# EAGLE design rotor_khamex_3.1 (EAGLE 7.6.0)

## Sheet 1 of 2
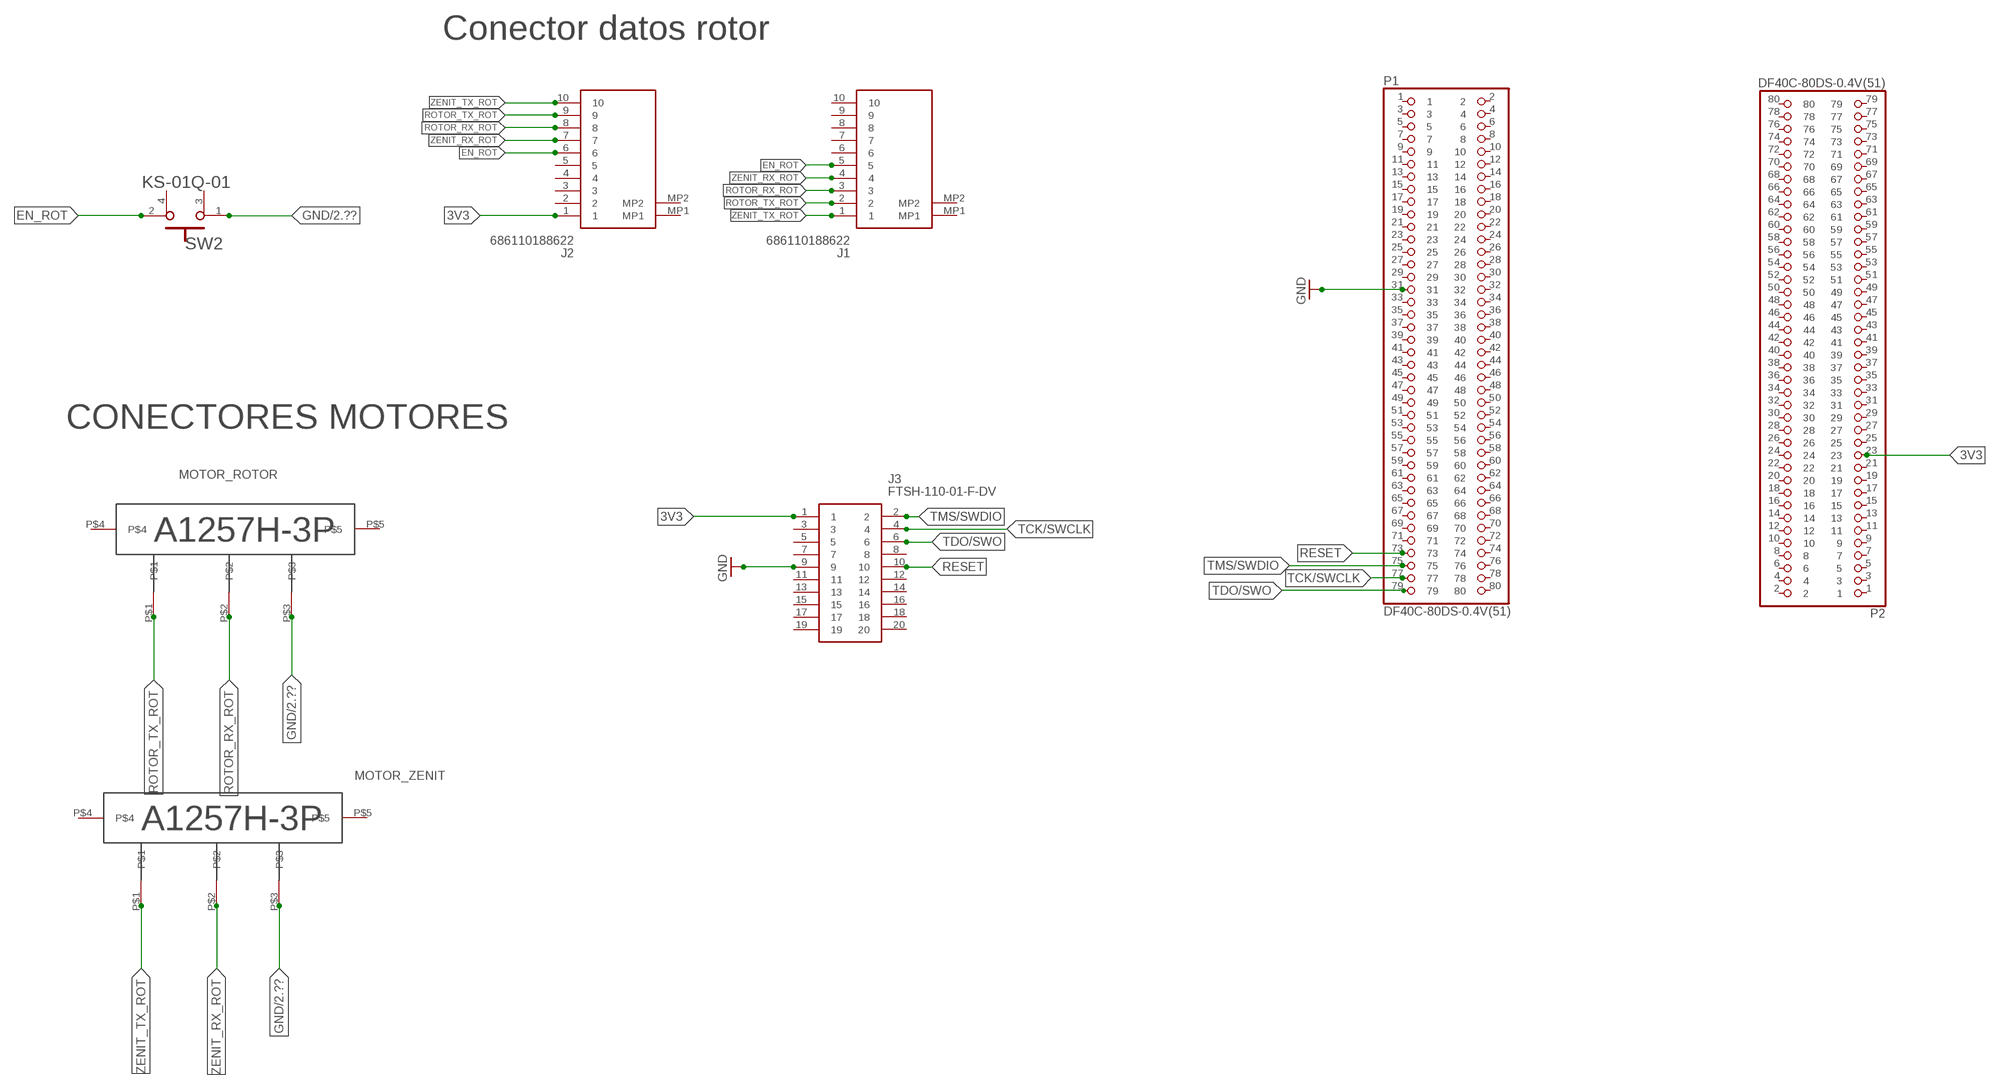
[diagram p0: schematic, sheet 1]

### Parts
J1  686110188622  [686110188622]
J2  686110188622  [686110188622]
J3  FTSH-110-01-F-DV  [FTSH-110-XX-YYY-DV]
MOTOR_ROTOR  A1257H-3P_DEVICE  [A1257H-3P_PACK]
MOTOR_ZENIT  A1257H-3P_DEVICE  [A1257H-3P_PACK]
P1  DF40C-80DS-0.4V(51)  [HRS_DF40C-80DS-0.4V(51)]
P2  DF40C-80DS-0.4V(51)  [HRS_DF40C-80DS-0.4V(51)]
SW2  E-SWITCH_KS-01Q-01E-SWITCH_KS-01Q-01_0_0  [E-SWITCH_KS-01Q-01_0]

### Nets
3V3: J2.1 J3.1 P2.23
EN_ROT: J1.5 J2.6 SW2.2
GND: J3.9 MOTOR_ROTOR.P$3 MOTOR_ZENIT.P$3 P1.31 SW2.1 ; also sheet 2
RESET: J3.10 P1.73
ROTOR_RX_ROT: J1.3 J2.8 MOTOR_ROTOR.P$2
ROTOR_TX_ROT: J1.2 J2.9 MOTOR_ROTOR.P$1
TCK/SWCLK: J3.4 P1.77
TDO/SWO: J3.6
TMS/SWDIO: J3.2 P1.75
ZENIT_RX_ROT: J1.4 J2.7 MOTOR_ZENIT.P$2
ZENIT_TX_ROT: J1.1 J2.10 MOTOR_ZENIT.P$1
Unconnected: J1.6 J1.7 J1.8 J1.9 J1.10 J1.MP1 J1.MP2 J2.2 J2.3 J2.4 J2.5 J2.MP1 J2.MP2 J3.3 J3.5 J3.7 J3.8 J3.11 J3.12 J3.13 J3.14 J3.15 J3.16 J3.17 J3.18 J3.19 J3.20 MOTOR_ROTOR.P$4 MOTOR_ROTOR.P$5 MOTOR_ZENIT.P$4 MOTOR_ZENIT.P$5 P1.1 P1.2 P1.3 P1.4 P1.5 P1.6 P1.7 P1.8 P1.9 P1.10 P1.11 P1.12 P1.13 P1.14 P1.15 P1.16 P1.17 P1.18 P1.19 P1.20 P1.21 P1.22 P1.23 P1.24 P1.25 P1.26 P1.27 P1.28 P1.29 P1.30 P1.32 P1.33 P1.34 P1.35 P1.36 P1.37 P1.38 P1.39 P1.40 P1.41 P1.42 P1.43 P1.44 P1.45 P1.46 P1.47 P1.48 P1.49 P1.50 P1.51 P1.52 P1.53 P1.54 P1.55 P1.56 P1.57 P1.58 P1.59 P1.60 P1.61 P1.62 P1.63 P1.64 P1.65 P1.66 P1.67 P1.68 P1.69 P1.70 P1.71 P1.72 P1.74 P1.76 P1.78 P1.79 P1.80 P2.1 P2.2 P2.3 P2.4 P2.5 P2.6 P2.7 P2.8 P2.9 P2.10 P2.11 P2.12 P2.13 P2.14 P2.15 P2.16 P2.17 P2.18 P2.19 P2.20 P2.21 P2.22 P2.24 P2.25 P2.26 P2.27 P2.28 P2.29 P2.30 P2.31 P2.32 P2.33 P2.34 P2.35 P2.36 P2.37 P2.38 P2.39 P2.40 P2.41 P2.42 P2.43 P2.44 P2.45 P2.46 P2.47 P2.48 P2.49 P2.50 P2.51 P2.52 P2.53 P2.54 P2.55 P2.56 P2.57 P2.58 P2.59 P2.60 P2.61 P2.62 P2.63 P2.64 P2.65 P2.66 P2.67 P2.68 P2.69 P2.70 P2.71 P2.72 P2.73 P2.74 P2.75 P2.76 P2.77 P2.78 P2.79 P2.80 SW2.3 SW2.4

### Notes on the sheet
- Conector datos rotor
- CONECTORES MOTORES
- MOTOR_ROTOR
- MOTOR_ZENIT

## Sheet 2 of 2
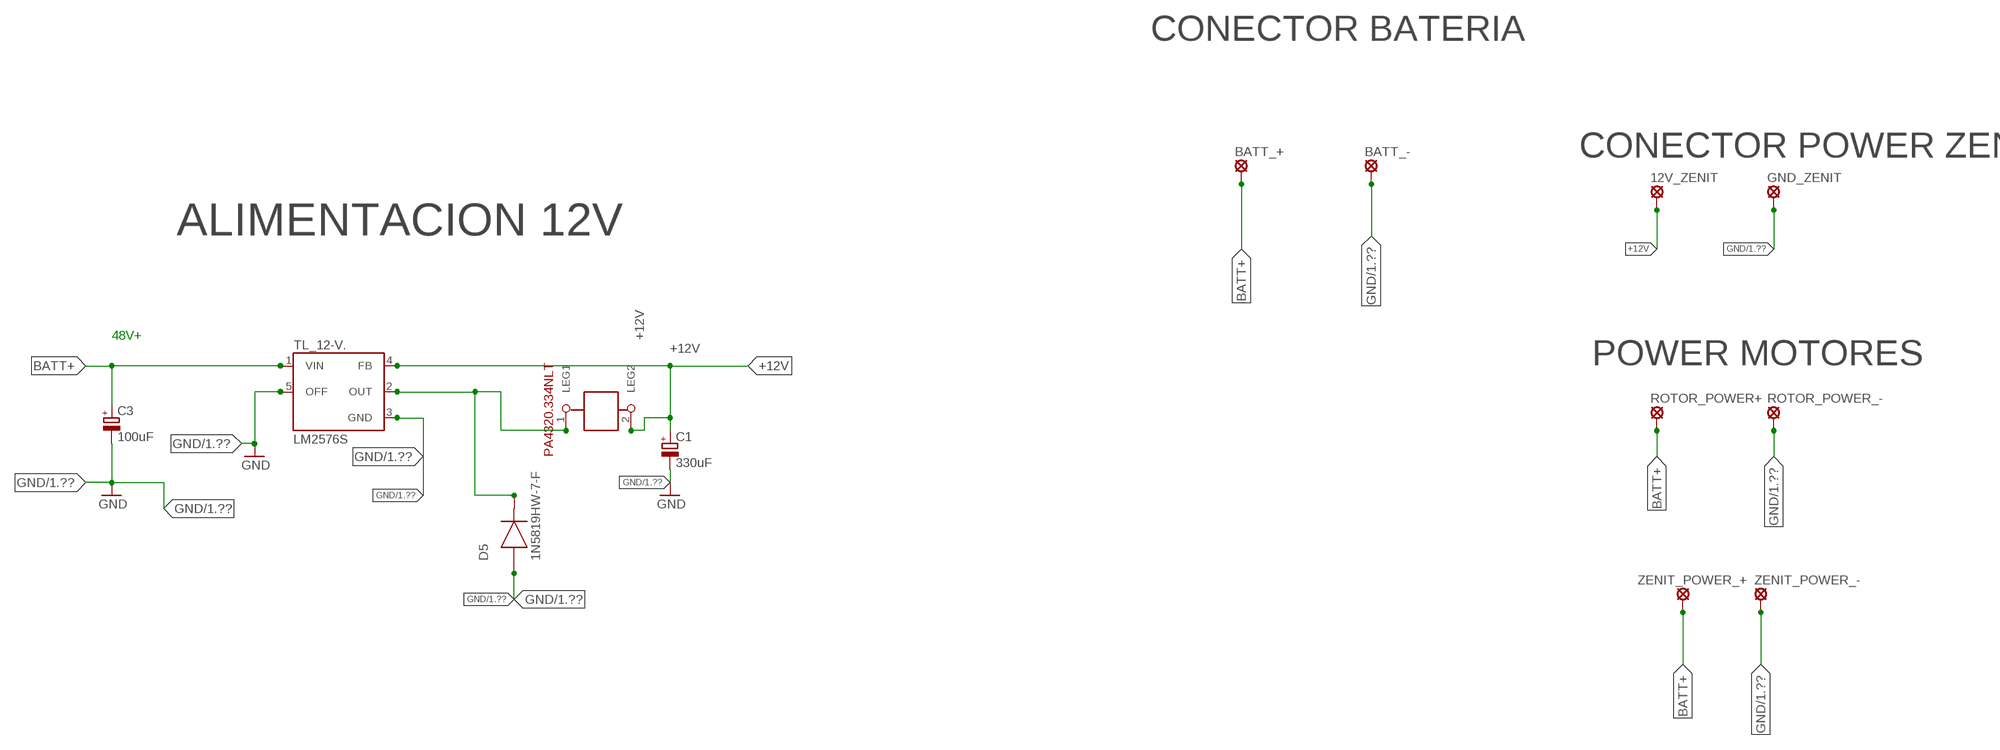
[diagram p1: schematic, sheet 2]

### Parts
12V_ZENIT  SE14  [SE14]
BATT_+  SE14  [SE14]
BATT_-  SE14  [SE14]
C1  330uF  CPOL-EUE5-10.5  [E5-10,5]
C3  100uF  CPOL-EUE5-10.5  [E5-10,5]
D5  1N5819HW-7-F  [SOD370155X135]
GND_ZENIT  SE14  [SE14]
L  1212  [1212SMDINDUCTORPACK]
ROTOR_POWER+  SE14  [SE14]
ROTOR_POWER_-  SE14  [SE14]
TL_12-V.  LM2576S  [TO263-5]
ZENIT_POWER_+  SE14  [SE14]
ZENIT_POWER_-  SE14  [SE14]

### Nets
+12V [power]: 12V_ZENIT.MP C1.+ L.2(LEG2) TL_12-V..4(FB)
BATT+: BATT_+.MP C3.+ ROTOR_POWER+.MP TL_12-V..1(VIN) ZENIT_POWER_+.MP
GND: BATT_-.MP C1.- C3.- D5.2(A) GND_ZENIT.MP ROTOR_POWER_-.MP TL_12-V..3(GND) TL_12-V..5(OFF) ZENIT_POWER_-.MP ; also sheet 1
N$2 [power]: D5.1(C) L.1(LEG1) TL_12-V..2(OUT)

### Notes on the sheet
- CONECTOR BATERIA
- CONECTOR POWER ZENIT
- ALIMENTACION 12V
- 48V+
- POWER MOTORES

## Library data of the parts
12V_ZENIT BATT_+ BATT_- GND_ZENIT ROTOR_POWER+ ROTOR_POWER_- ZENIT_POWER_+ ZENIT_POWER_- = solpad:SE14: SOLDER PAD E1553, drill 1,4mm, distributor Buerklin, 07F820
C1 C3 = rcl:CPOL-EU: POLARIZED CAPACITOR, European symbol
D5 = 1N5819HW-7-F:1N5819HW-7-F: 1N5819HW Series 40 V 1 A Surface Mount Schottky Barrier Rectifier - SOD-123; DESCRIPTION: 1N5819HW Series 40 V 1 A Surface Mount Schottky Barrier Rectifier - SOD-123; DIGI-KEY_PART_NUMBER: 1N5819HW-FDICT-ND; DIGI-KEY_PURCHASE_URL: https://www.digikey.es/product-detail/en/diodes-incorporated/1N5819HW-7-F/1N5819HW-FDICT-ND/815283?utm_source=snapeda&utm_medium=aggregator&utm_campaign=symbol; MF: Diodes Inc.; MP: 1N5819HW-7-F; PACKAGE: SOD-123 Diodes Inc.
J1 J2 = 686110188622:686110188622: FFC & FPC Connectors WR-FPC 1,0mm SMT Horiz. Top Contact Tin Plating{0000} Source: Datasheet <https://www.mouser.ch/datasheet/2/445/686110188622-1843591.pdf>; DESCRIPTION: FFC & FPC Connectors WR-FPC 1,0mm SMT Horiz. Top Contact Tin Plating{0000}; HEIGHT: 3.3mm; MANUFACTURER_NAME: Wurth Elektronik; MANUFACTURER_PART_NUMBER: 686110188622; MOUSER_PART_NUMBER: 710-686110188622; MOUSER_PRICE-STOCK: https://www.mouser.co.uk/ProductDetail/Wurth-Elektronik/686110188622?qs=OlC7AqGiEDnHUpT6yh27Lg%3D%3D
J3 = FTSH-110-01-F-DV:FTSH-110-01-F-DV: 20 Position, High Reliability Header Strips, 0.050" pitch Source: Datasheet <http://suddendocs.samtec.com/prints/ftsh-1xx-xx-xxx-dv-xxx-xxx-mkt.pdf>; DESCRIPTION: 20 Position, High Reliability Header Strips, 0.050&quot; pitch; HEIGHT: mm; MANUFACTURER_NAME: SAMTEC; MANUFACTURER_PART_NUMBER: FTSH-110-01-F-DV; MOUSER_PART_NUMBER: 200-FTSH11001FDV; MOUSER_PRICE-STOCK: https://www.mouser.co.uk/ProductDetail/Samtec/FTSH-110-01-F-DV?qs=92ilVni64gw1JaTDl9rCLg%3D%3D
L = smd 1212 inductor:1212
MOTOR_ROTOR MOTOR_ZENIT = A1257H-3P:A1257H-3P_DEVICE
P1 P2 = DF40C-80DS-0.4V_51_(1):DF40C-80DS-0.4V(51); CHECK_PRICES: https://www.snapeda.com/parts/DF40C-80DS-0.4V(51)/Hirose/view-part/?ref=eda; DESCRIPTION: Receptáculo del conector de la posición 80, contactos de la tira central Montaje en superficie Oro; DIGIKEY_PART_NUMBER: H11633CT-ND; MF: Hirose; MP: DF40C-80DS-0.4V(51); PACKAGE: None; SNAPEDA_LINK: https://www.snapeda.com/parts/DF40C-80DS-0.4V(51)/Hirose/view-part/?ref=snap
SW2 = E-Switch - KS-01Q-01:E-SWITCH_KS-01Q-01: Pushbutton Switch SPST-NO Standard Through Hole; ACTUATOR_TYPE: Round, Button; CAPACITANCE: 1.0pF; CURRENT_RATING: 10mA (DC); DATASHEET: https://upverter.com/datasheet/3b708556f29b55c7f5db677c77a74973be95ebea.pdf; DIGIKEY_DESCRIPTION: SWITCH Pushbutton Switch SPST-NO Standard Through Hole; DIGIKEY_PART_NUMBER: EG4791-ND; ELECTRICAL_LIFE: 250,000 Cycles; IMPORTED_FROM: octopart; LEAD_FREE: yes; MECHANICAL_LIFE: 500,000 Cycles; MF: E-Switch; MFG_PACKAGE_IDENT: 29-KS01Q01; MOUSER_PART_NUMBER: 612-KS-01Q-01; MPN: KS-01Q-01; NUM_PINS: 4; OCTOPART_PART_NUMBER: 72a6bab923faad61; PACKAGE: SW_PTH_12MM; PREFIX: SW; ROHS: yes; TEMPERATURE_RANGE_HIGH: +85°C; TEMPERATURE_RANGE_LOW: -20°C; VOLTAGE_RATING_-_DC: 35V; VOLTAGE_RATING_AC: 35 V
TL_12-V. = v-reg-3:LM2576: National Semiconductor <http://www.national.com> 3.0A "Simple Switcher"(c) 52kHz, Vout 1.23-37V (HV: 57V), Vin 40V (HV: 60V), 50µA standby current

## Net classes
0 default: width 0.381 mm, drill 0.01 mm, clearance 0.254 mm
1 power: width 1.27 mm, drill 0.762 mm, clearance 0.254 mm
2 thin: width 0.254 mm, drill 0.254 mm, clearance 0.254 mm

## Board
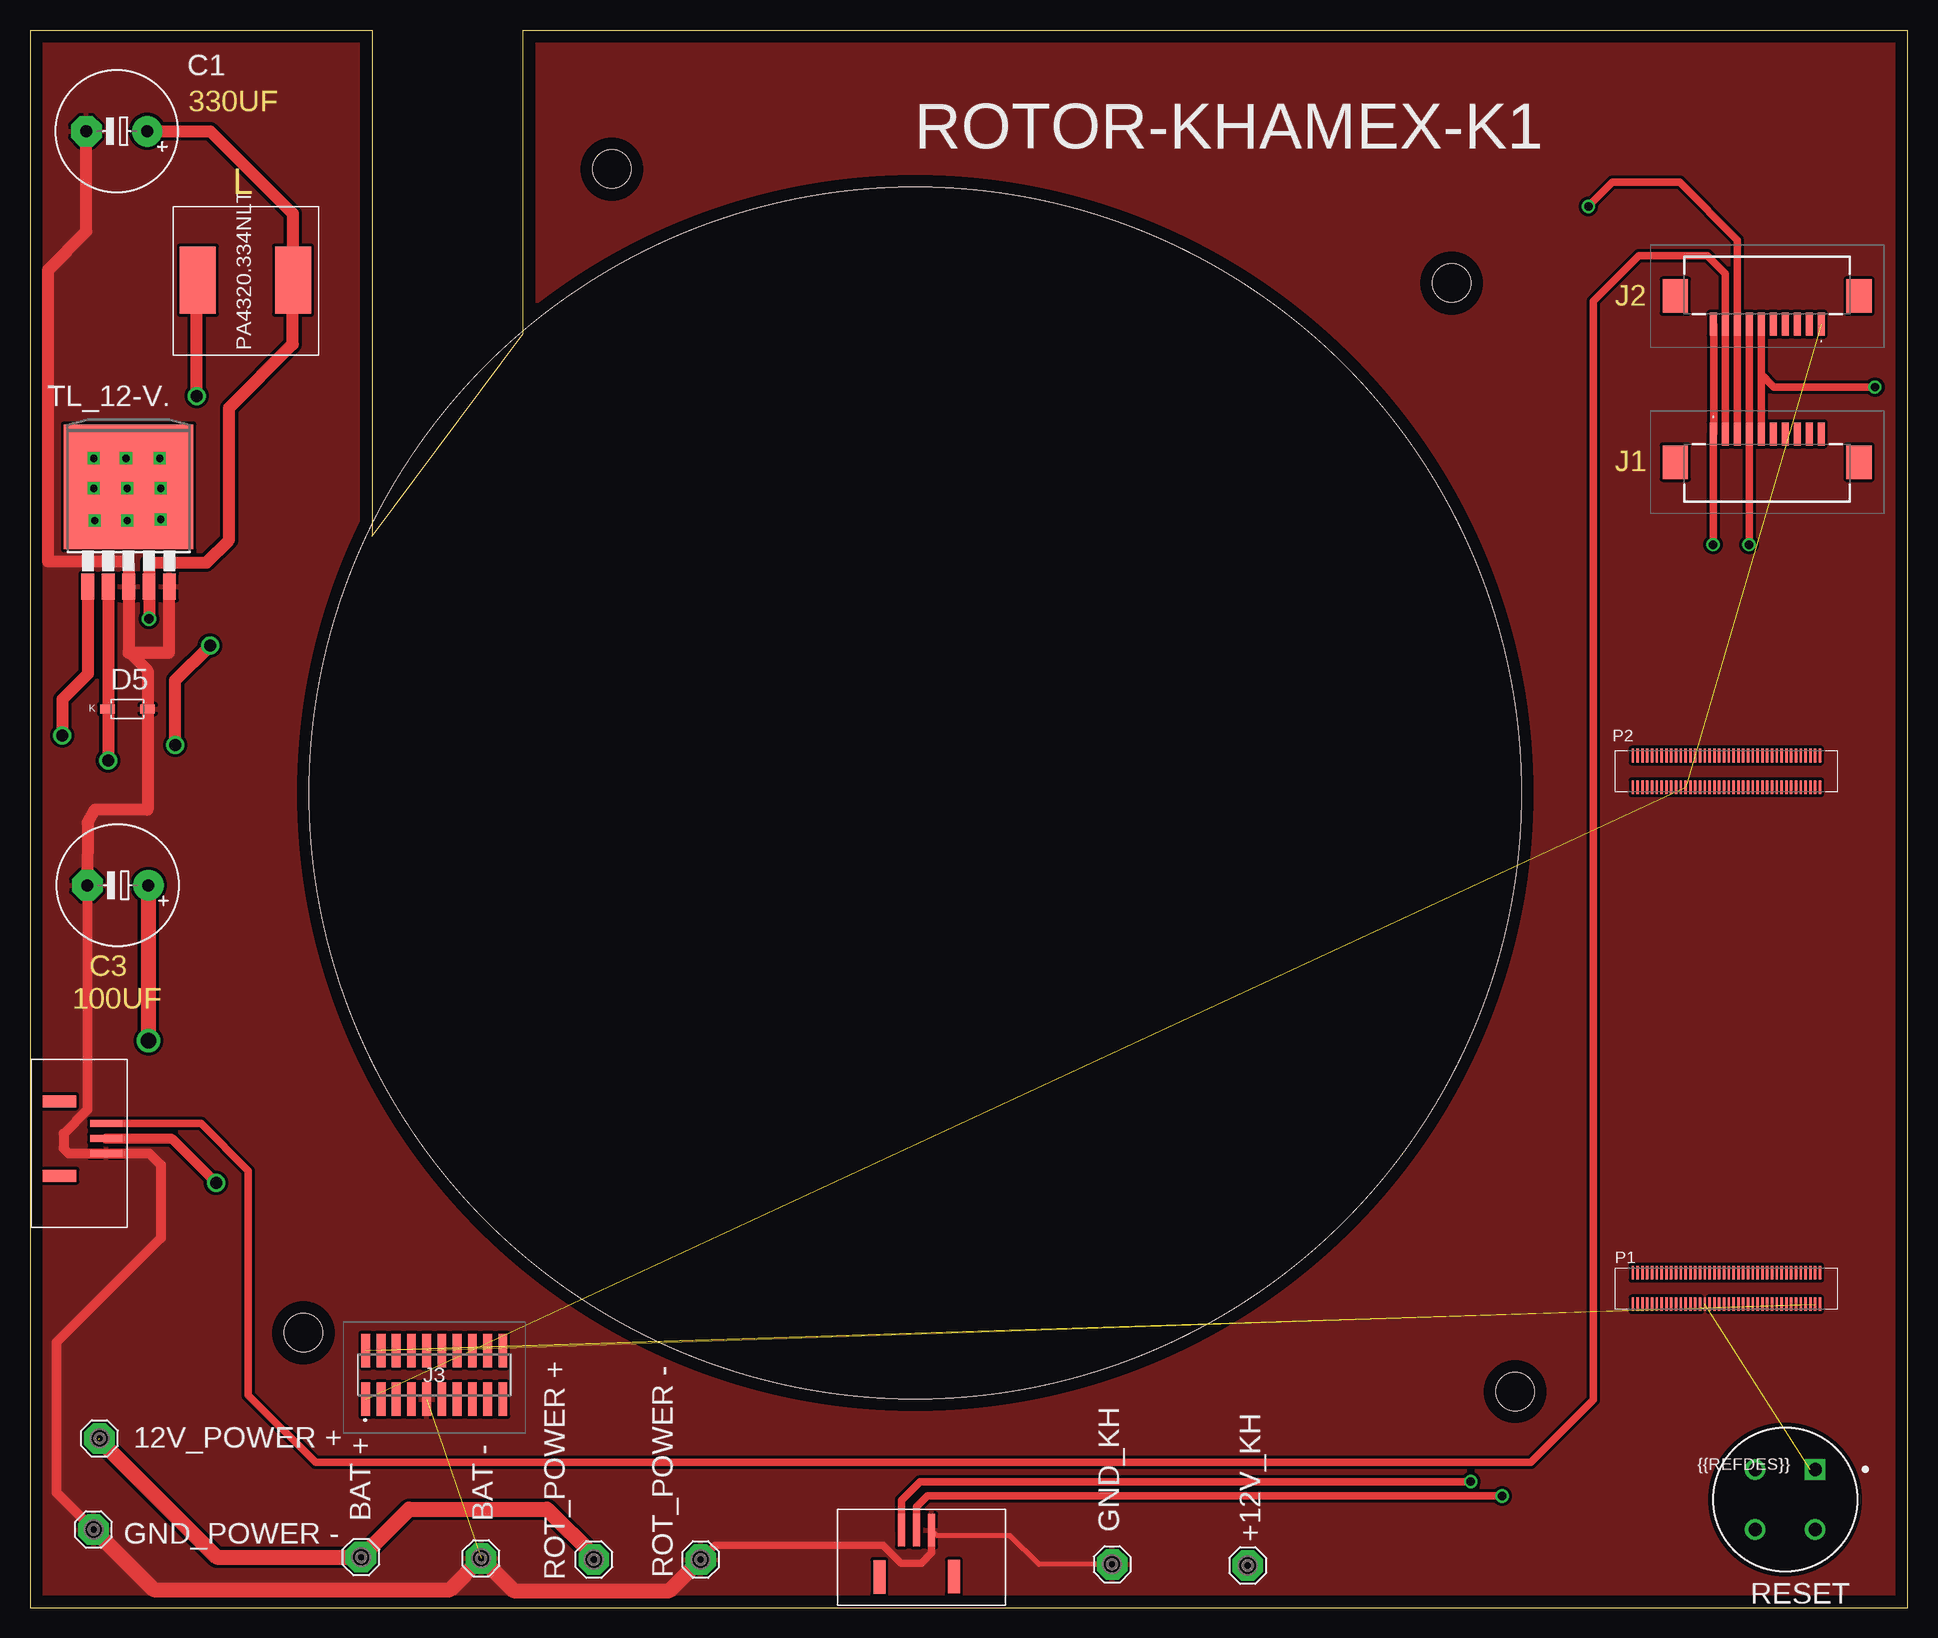
[diagram p2: board, top side]
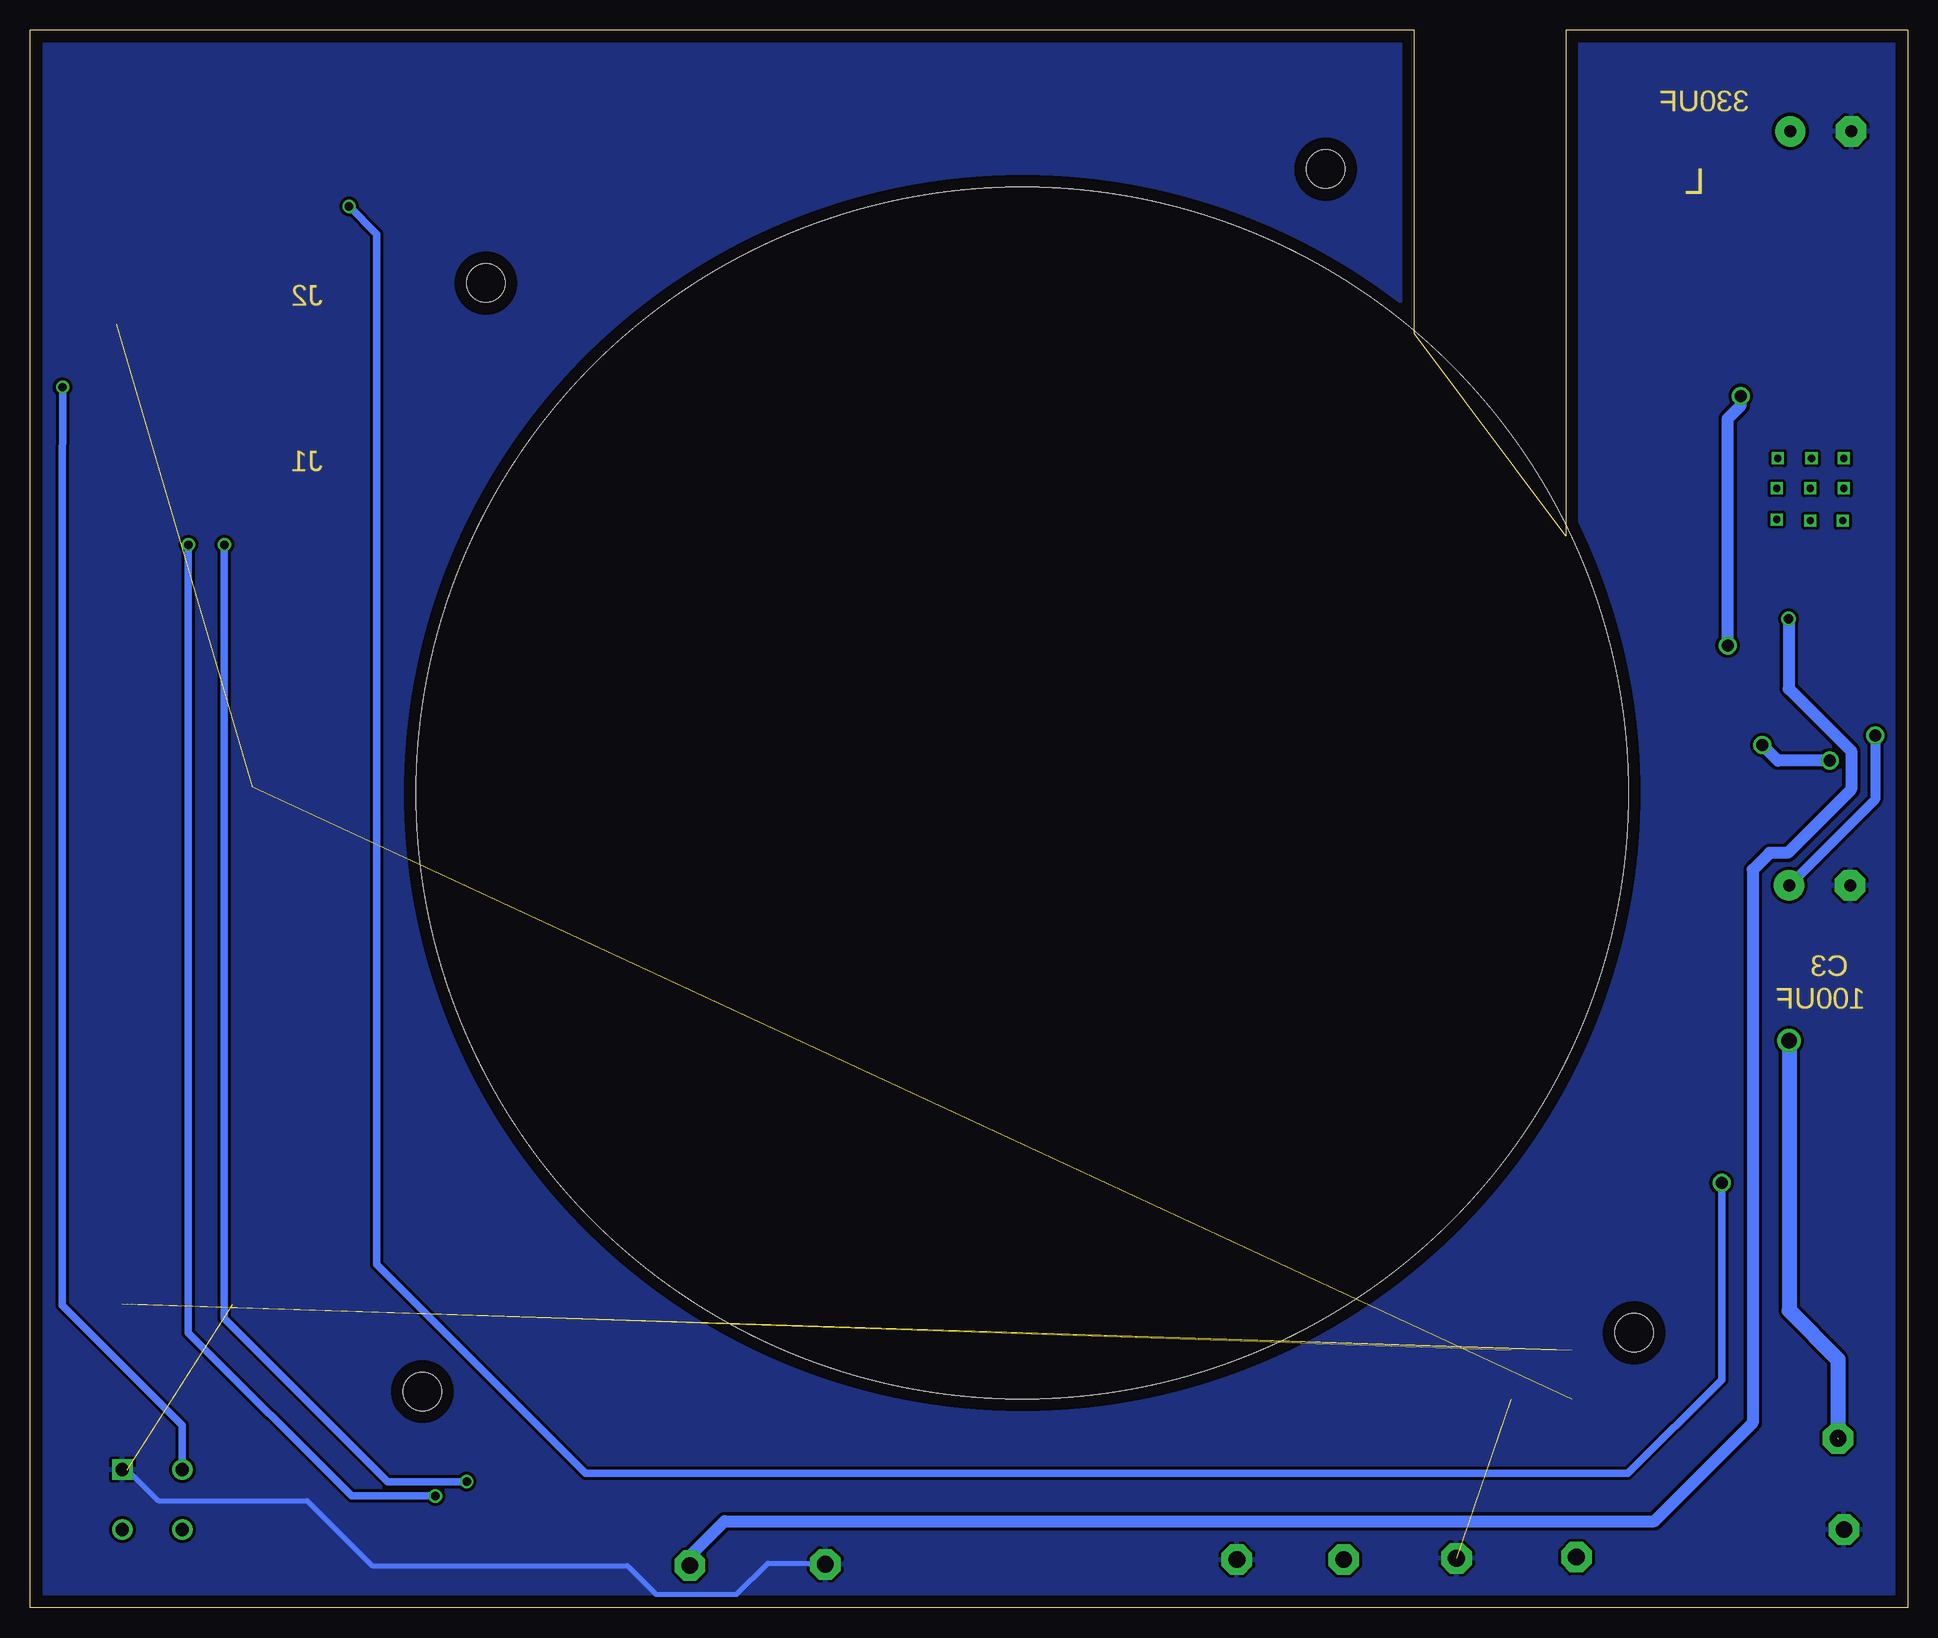
[diagram p3: board, bottom side, seen from below]

Size 156.5 x 131.5 mm. Coordinates in mm from the lower left corner, seen from the top.
Outline: 0,0 156.5,0 156.5,131.5 41.1,131.5 41.1,106.2 28.5,89.3 28.5,131.5 0,131.5 0,0
Copper layers (1*2*15*16): Top 0.035mm / dielectric 1.5mm / Route2 0.035mm / dielectric 0.15mm / Route15 0.035mm / dielectric 0.2mm / Bottom 0.035mm
Design rules "default *": minimum track width 10mil, minimum drill 24mil, track to track 8mil, track to pad 8mil, pad to pad 8mil, via to via 8mil, smd to smd 8mil, copper to edge 40mil, drill to drill 8mil, minimum pad ring 10mil, minimum via ring 8mil, stop-mask expansion 4mil, vias tented up to drill 0mil, thermal gap 10mil
Holes 101 mm at 73.8,67.9
Holes 3.2 mm at 48.5,119.9 22.8,22.9 123.8,18 118.5,110.4

### Footprints (pad centres in the part's own frame; a part is rotated, then mirrored left to right if it is on the bottom)
SE14 = drill 1.397 pad 2.54 octagon: MP 0,0
E5-10,5 = drill 1.016 pad 2.54: + -2.54,0 | drill 1.016 pad 2.54 octagon: - 2.54,0
SOD370155X135 = smd 1.21 x 0.73: 1 -1.68,0; 2 1.68,0
686110188622 = smd 0.6 x 1.9: 1 -4.5,2.825; 2 -3.5,2.825; 3 -2.5,2.825; 4 -1.5,2.825; 5 -0.5,2.825; 6 0.5,2.825; 7 1.5,2.825; 8 2.5,2.825; 9 3.5,2.825; 10 4.5,2.825 | smd 2.1 x 2.8: MP1 -7.65,0.475; MP2 7.65,0.475
FTSH-110-XX-YYY-DV = smd 0.74 x 2.79: 1 -5.715,-2.035; 2 -5.715,2.035; 3 -4.445,-2.035; 4 -4.445,2.035; 5 -3.175,-2.035; 6 -3.175,2.035; 7 -1.905,-2.035; 8 -1.905,2.035; 9 -0.635,-2.035; 10 -0.635,2.035; 11 0.635,-2.035; 12 0.635,2.035; 13 1.905,-2.035; 14 1.905,2.035; 15 3.175,-2.035; 16 3.175,2.035; 17 4.445,-2.035; 18 4.445,2.035; 19 5.715,-2.035; 20 5.715,2.035
1212SMDINDUCTORPACK = smd 5.6 x 3: 1 -0.1,3.91; 2 -0.1,-4.045
A1257H-3P_PACK = smd 0.6 x 2.7: P$1 2.35,5.25; P$2 3.6,5.25; P$3 4.85,5.25 | smd 1 x 2.8: P$4 0.5,1.35; P$5 6.7,1.37
HRS_DF40C-80DS-0.4V(51) = smd 0.2 x 1.14: 1 -7.8,-1.32; 2 -7.8,1.32; 3 -7.4,-1.32; 4 -7.4,1.32; 5 -7,-1.32; 6 -7,1.32; 7 -6.6,-1.32; 8 -6.6,1.32; 9 -6.2,-1.32; 10 -6.2,1.32; 11 -5.8,-1.32; 12 -5.8,1.32; 13 -5.4,-1.32; 14 -5.4,1.32; 15 -5,-1.32; 16 -5,1.32; 17 -4.6,-1.32; 18 -4.6,1.32; 19 -4.2,-1.32; 20 -4.2,1.32; 21 -3.8,-1.32; 22 -3.8,1.32; 23 -3.4,-1.32; 24 -3.4,1.32; 25 -3,-1.32; 26 -3,1.32; 27 -2.6,-1.32; 28 -2.6,1.32; 29 -2.2,-1.32; 30 -2.2,1.32; 31 -1.8,-1.32; 32 -1.8,1.32; 33 -1.4,-1.32; 34 -1.4,1.32; 35 -1,-1.32; 36 -1,1.32; 37 -0.6,-1.32; 38 -0.6,1.32; 39 -0.2,-1.32; 40 -0.2,1.32; 41 0.2,-1.32; 42 0.2,1.32; 43 0.6,-1.32; 44 0.6,1.32; 45 1,-1.32; 46 1,1.32; 47 1.4,-1.32; 48 1.4,1.32; 49 1.8,-1.32; 50 1.8,1.32; 51 2.2,-1.32; 52 2.2,1.32; 53 2.6,-1.32; 54 2.6,1.32; 55 3,-1.32; 56 3,1.32; 57 3.4,-1.32; 58 3.4,1.32; 59 3.8,-1.32; 60 3.8,1.32; 61 4.2,-1.32; 62 4.2,1.32; 63 4.6,-1.32; 64 4.6,1.32; 65 5,-1.32; 66 5,1.32; 67 5.4,-1.32; 68 5.4,1.32; 69 5.8,-1.32; 70 5.8,1.32; 71 6.2,-1.32; 72 6.2,1.32; 73 6.6,-1.32; 74 6.6,1.32; 75 7,-1.32; 76 7,1.32; 77 7.4,-1.32; 78 7.4,1.32; 79 7.8,-1.32; 80 7.8,1.32
E-SWITCH_KS-01Q-01_0 = drill 1.1 pad 1.7 square: 1 2.5,2.5 | drill 1.1 pad 1.7: 2 -2.5,2.5; 3 2.5,-2.5; 4 -2.5,-2.5
TO263-5 = smd 1.067 x 2.159: 1 -3.404,-5.791; 2 -1.702,-5.791; 3 0,-5.791; 4 1.702,-5.791; 5 3.404,-5.791 | smd 10.8 x 10.41: 6 0,2.54

### Placement (x,y rotation side)
12V_ZENIT  101.5,3.5 0 top
BATT_+  27.6,4.2 180 top
BATT_-  37.6,4.1 180 top
C1  7.23,123.06 180 top
C3  7.32,60.2 180 top
D5  8.13,74.9 0 top
GND_ZENIT  90.2,3.6 0 top
J1  144.8,95 0 top
J2  144.8,109.8 180 top
J3  33.7,19.4 0 top
L  17.89,110.74 90 top
MOTOR_ROTOR  1.1,42.7 270 top
MOTOR_ZENIT  70.3,1.2 0 top
P1  141.4,26.6 0 top
P2  141.4,69.7 0 top
ROTOR_POWER+  47,4 180 top
ROTOR_POWER_-  55.9,4 180 top
SW2  146.3,9 0 top
TL_12-V.  8.22,90.88 0 top
ZENIT_POWER_+  5.8,14.1 180 top
ZENIT_POWER_-  5.3,6.5 180 top

### Tracks (layer width: path | path; a pad name or v marks a point on that pad's centre or on a via)
3V3  (2 unrouted)
+12V  (via drill 0.8)
  Top 1.016: TL_12-V..4 9.92,87.1 14.7,87.1 16.6,89 16.6,100 21.9,105.3 21.9,110 21.8,110.1 21.8,110.5 L.2 21.9,110.67 21.9,116.2 15.04,123.06 C1.+ | TL_12-V..4 | TL_12-V..4 9.92,82.4 v9.9,82.4
  Bottom 1.016: v9.9,82.4 9.9,76.6 4.7,71.4 4.7,68.2 10,62.9 11.5,62.9 12.9,61.5 12.9,15.4 21.1,7.2 98.6,7.2 101.5,4.3 12V_ZENIT.MP
BATT+  (via drill 1, 1.3)  (1 unrouted)
  Top 1.016: TL_12-V..1 4.82,77.82 2.7,75.7 v2.7,72.7
  Top 1.27: ROTOR_POWER+.MP 47,4.3 43.1,8.2 31.6,8.2 BATT_+.MP 15.57,4.2 5.73,14.03 | C3.+ v9.86,47.25
  Bottom 0.813: v2.7,72.7 2.7,67.36 C3.+
  Bottom 1.27: v9.86,47.25 9.86,24.76 5.8,20.7 ZENIT_POWER_+.MP
EN_ROT  (via drill 0.7)
  Top 0.61: v153.78,101.73 145.37,101.73 144.3,102.8 | 144.3,102.8 J2.6 | J1.5 144.3,102.8
  Bottom 0.61: SW2.2 143.8,15.2 153.8,25.2 153.8,92.11 v153.78,101.73
GND  (2 unrouted)
  Top 0.406: GND_ZENIT.MP 84.1,3.6 81.7,6 75.6,6 MOTOR_ZENIT.P$3
  Top 0.61: MOTOR_ZENIT.P$3 75.15,4.55 74.3,3.7 72.6,3.7 71.1,5.2 57.1,5.2 ROTOR_POWER_-.MP | 6.3,37.8 MOTOR_ROTOR.P$3
  Top 0.813: C3.- 4.78,41.48 2.8,39.5 2.8,38.28 3.23,37.85 MOTOR_ROTOR.P$3 9.95,37.85 10.9,36.9 10.9,30.8 2.2,22.1 2.2,9.6 ZENIT_POWER_-.MP
  Top 1.016: TL_12-V..3 8.22,87.08 8.2,87.1 8.2,87.2 1.5,87.2 1.5,111.5 4.7,114.7 C1.- | TL_12-V..3 8.22,79.68 9.8,78.1 D5.2 9.81,66.51 5.4,66.5 4.8,65.42 C3.- | TL_12-V..3 8.22,79.6 11.6,79.6 11.6,85.09 TL_12-V..5
  Top 1.27: ZENIT_POWER_-.MP 10.3,1.5 35,1.5 BATT_-.MP 40.3,1.4 53.3,1.4 ROTOR_POWER_-.MP
  Bottom 0.406: SW2.1 148.4,11.5 145.8,8.9 133.4,8.9 128,3.5 106.7,3.5 104.3,1.1 97.6,1.1 95,3.7 90.3,3.7 GND_ZENIT.MP
  pour Top: -6.4,139.1 169.8,139.1 169.8,-9.4 -6.4,-9.4
  pour Bottom: -3.3,135.4 162.5,135.4 162.5,-4.9 -3.3,-4.9
N$1  (via drill 0.6)
  other vias: 5.3,95.8
N$2  (via drill 1)
  Top 1.016: D5.1 6.52,74.97 TL_12-V..2 6.52,70.6 v6.5,70.6 | v12.1,71.9 12.1,77.3 v15,80.2 | 13.72,110.9 L.1 13.9,110.64 v13.9,101
  Bottom 1.016: v6.5,70.6 10.8,70.6 v12.1,71.9 | v15,80.2 15,99.1 13.9,100.2 v13.9,101
N$3  (via drill 0.6)
  other vias: 8,95.8
N$4  (via drill 0.6)
  other vias: 10.8,95.8
N$5  (via drill 0.6)
  other vias: 5.3,93.3
N$6  (via drill 0.6)
  other vias: 8.1,93.3
N$7  (via drill 0.6)
  other vias: 10.9,93.3
N$8  (via drill 0.6)
  other vias: 10.9,90.7
N$9  (via drill 0.6)
  other vias: 8.1,90.6
N$10  (via drill 0.6)
  other vias: 5.4,90.6
RESET  (1 unrouted)
ROTOR_RX_ROT  (via drill 0.7, 1)
  Top 0.381: 6.35,39.16 MOTOR_ROTOR.P$2
  Top 0.61: J1.3 J2.8 142.3,114 137.5,118.8 131.9,118.8 v129.9,116.8
  Top 0.813: MOTOR_ROTOR.P$2 11.8,39.1 v15.5,35.4
  Bottom 0.61: v15.5,35.4 15.5,19 23.3,11.2 110.2,11.2 127.6,28.6 127.6,114.5 v129.9,116.8
ROTOR_TX_ROT
  Top 0.61: J1.2 J2.9 141.3,111.2 139.8,112.7 134.1,112.7 130.3,108.9 130.3,17.3 125.1,12.1 23.8,12.1 18.2,17.7 18.2,36.4 14.25,40.35 MOTOR_ROTOR.P$1
TCK/SWCLK  (1 unrouted)
TMS/SWDIO  (1 unrouted)
ZENIT_RX_ROT  (via drill 0.7)
  Top 0.61: J2.7 J1.4 v143.3,88.6 | v122.7,9.3 74.8,9.3 73.9,8.4 MOTOR_ZENIT.P$2
  Bottom 0.61: v122.7,9.3 129.7,9.3 143.3,22.9 v143.3,88.6
ZENIT_TX_ROT  (via drill 0.7)
  Top 0.381: 140.34,106.95 J2.10
  Top 0.61: 140.34,106.95 140.34,97.86 J1.1 v140.3,88.6 | v120.1,10.5 74.2,10.5 72.65,8.95 MOTOR_ZENIT.P$1
  Bottom 0.61: v120.1,10.5 126.7,10.5 140.3,24.1 v140.3,88.6

### Text on the board
Dimension: 330UF | L | J2 | J1 | C3 | 100UF
tNames: C1 | ROTOR-KHAMEX-K1 | TL_12-V. | D5 | +12V_KH | 12V_POWER + | BAT + | BAT - | GND_KH | GND_POWER - | ROT_POWER + | ROT_POWER - | RESET